# Altium schematic sheet Control.SchDoc
size A4; SheetNumber: 1; SheetTotal: 7
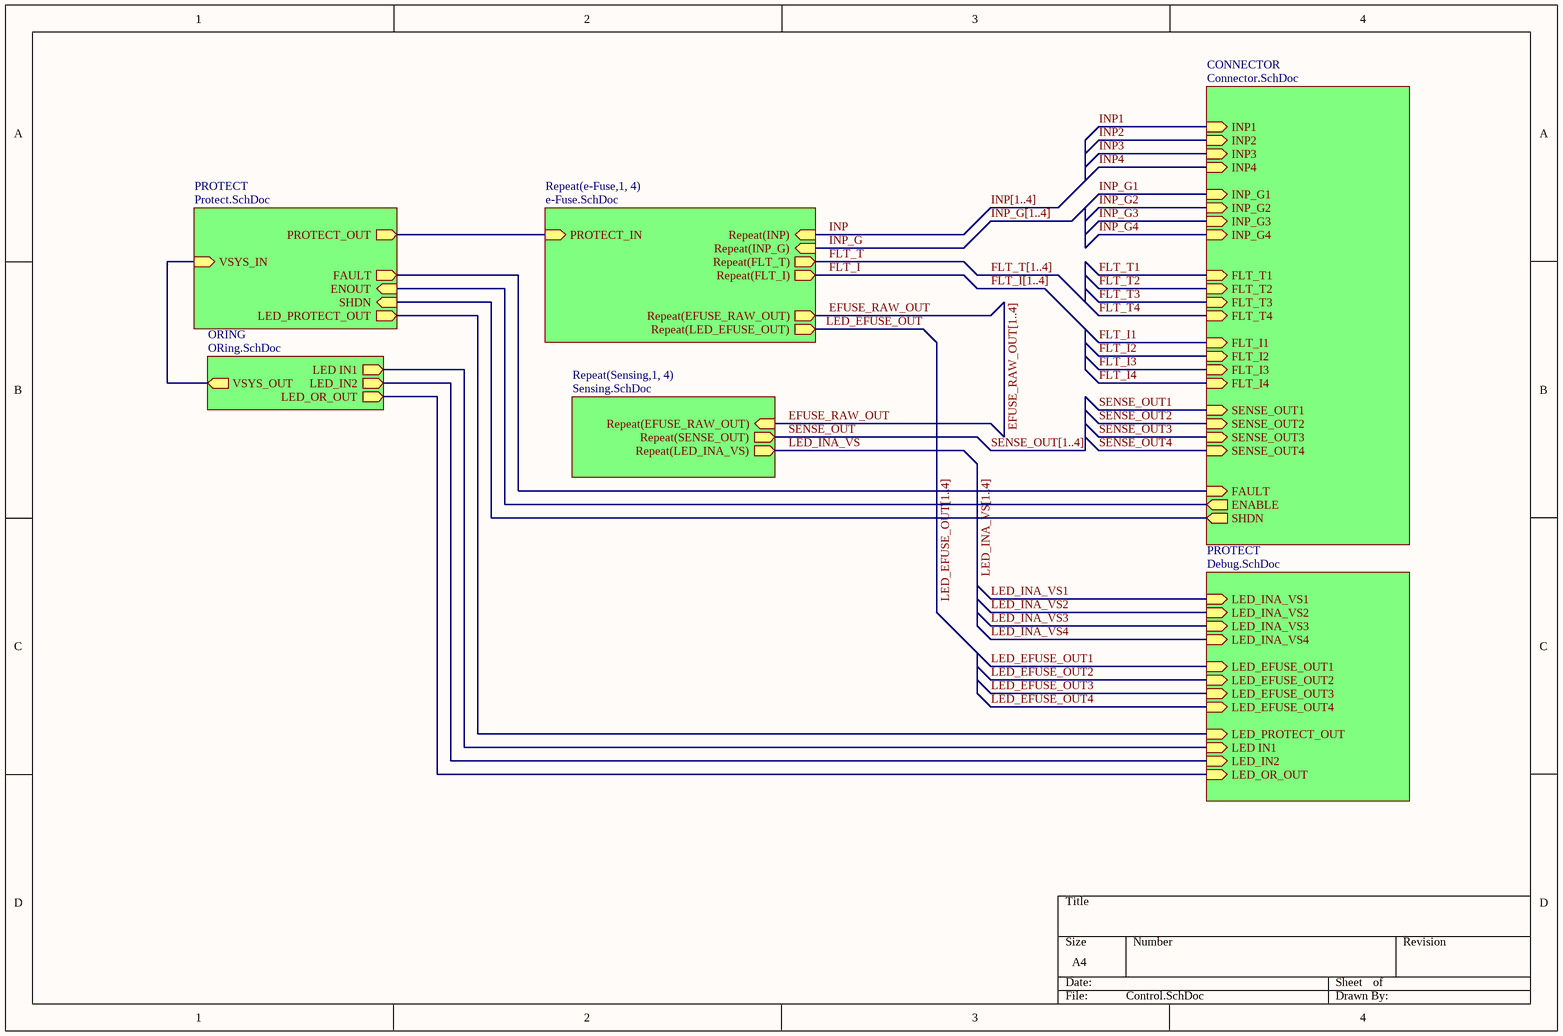
[diagram p0: Control.SchDoc]

## Sub-sheets
CONNECTOR = Connector.SchDoc: FLT_I4 (in), FLT_T4 (in), INP_G4 (in), INP4 (in), FLT_I3 (in), FLT_T3 (in), INP_G3 (in), INP3 (in), FLT_I2 (in), FLT_T2 (in), INP_G2 (in), INP2 (in), FLT_I1 (in), FLT_T1 (in), INP_G1 (in), INP1 (in), SENSE_OUT4 (in), SENSE_OUT3 (in), SENSE_OUT2 (in), SENSE_OUT1 (in), FAULT (in), ENABLE (out), SHDN (out)
ORING = ORing.SchDoc: LED IN1 (out), LED_IN2 (out), LED_OR_OUT (out), VSYS_OUT (out)
PROTECT = Protect.SchDoc: PROTECT_OUT (out), SHDN (in), FAULT (out), VSYS_IN (in), ENOUT (in), LED_PROTECT_OUT (out)
PROTECT = Debug.SchDoc: LED_INA_VS1 (in), LED_INA_VS2 (in), LED_INA_VS3 (in), LED_INA_VS4 (in), LED_OR_OUT (in), LED_IN2 (in), LED IN1 (in), LED_PROTECT_OUT (in), LED_EFUSE_OUT1 (in), LED_EFUSE_OUT2 (in), LED_EFUSE_OUT3 (in), LED_EFUSE_OUT4 (in)
Repeat(e-Fuse,1, 4) = e-Fuse.SchDoc: Repeat(EFUSE_RAW_OUT) (out), Repeat(FLT_I) (out), Repeat(FLT_T) (out), Repeat(INP_G) (in), Repeat(INP) (in), PROTECT_IN (in), Repeat(LED_EFUSE_OUT) (out)
Repeat(Sensing,1, 4) = Sensing.SchDoc: Repeat(EFUSE_RAW_OUT) (in), Repeat(SENSE_OUT) (out), Repeat(LED_INA_VS) (out)

## Nets
EFUSE_RAW_OUT: sheet Repeat(e-Fuse,1, 4)/Repeat(EFUSE_RAW_OUT), sheet Repeat(Sensing,1, 4)/Repeat(EFUSE_RAW_OUT)
FLT_I: sheet Repeat(e-Fuse,1, 4)/Repeat(FLT_I)
FLT_I1: sheet CONNECTOR/FLT_I1
FLT_I2: sheet CONNECTOR/FLT_I2
FLT_I3: sheet CONNECTOR/FLT_I3
FLT_I4: sheet CONNECTOR/FLT_I4
FLT_T: sheet Repeat(e-Fuse,1, 4)/Repeat(FLT_T)
FLT_T1: sheet CONNECTOR/FLT_T1
FLT_T2: sheet CONNECTOR/FLT_T2
FLT_T3: sheet CONNECTOR/FLT_T3
FLT_T4: sheet CONNECTOR/FLT_T4
INP: sheet Repeat(e-Fuse,1, 4)/Repeat(INP)
INP1: sheet CONNECTOR/INP1
INP2: sheet CONNECTOR/INP2
INP3: sheet CONNECTOR/INP3
INP4: sheet CONNECTOR/INP4
INP_G: sheet Repeat(e-Fuse,1, 4)/Repeat(INP_G)
INP_G1: sheet CONNECTOR/INP_G1
INP_G2: sheet CONNECTOR/INP_G2
INP_G3: sheet CONNECTOR/INP_G3
INP_G4: sheet CONNECTOR/INP_G4
LED_EFUSE_OUT: sheet Repeat(e-Fuse,1, 4)/Repeat(LED_EFUSE_OUT)
LED_EFUSE_OUT1: sheet PROTECT/LED_EFUSE_OUT1
LED_EFUSE_OUT2: sheet PROTECT/LED_EFUSE_OUT2
LED_EFUSE_OUT3: sheet PROTECT/LED_EFUSE_OUT3
LED_EFUSE_OUT4: sheet PROTECT/LED_EFUSE_OUT4
LED_INA_VS: sheet Repeat(Sensing,1, 4)/Repeat(LED_INA_VS)
LED_INA_VS1: sheet PROTECT/LED_INA_VS1
LED_INA_VS2: sheet PROTECT/LED_INA_VS2
LED_INA_VS3: sheet PROTECT/LED_INA_VS3
LED_INA_VS4: sheet PROTECT/LED_INA_VS4
SENSE_OUT: sheet Repeat(Sensing,1, 4)/Repeat(SENSE_OUT)
SENSE_OUT1: sheet CONNECTOR/SENSE_OUT1
SENSE_OUT2: sheet CONNECTOR/SENSE_OUT2
SENSE_OUT3: sheet CONNECTOR/SENSE_OUT3
SENSE_OUT4: sheet CONNECTOR/SENSE_OUT4
(unnamed): sheet PROTECT/PROTECT_OUT, sheet Repeat(e-Fuse,1, 4)/PROTECT_IN
(unnamed): sheet PROTECT/SHDN, sheet CONNECTOR/SHDN
(unnamed): sheet PROTECT/FAULT, sheet CONNECTOR/FAULT
(unnamed): sheet PROTECT/VSYS_IN, sheet ORING/VSYS_OUT
(unnamed): sheet PROTECT/ENOUT, sheet CONNECTOR/ENABLE
(unnamed): sheet PROTECT/LED_PROTECT_OUT, sheet PROTECT/LED_PROTECT_OUT
(unnamed): sheet ORING/LED IN1, sheet PROTECT/LED IN1
(unnamed): sheet ORING/LED_IN2, sheet PROTECT/LED_IN2
(unnamed): sheet ORING/LED_OR_OUT, sheet PROTECT/LED_OR_OUT

## Buses and harness runs
bus EFUSE_RAW_OUT[1..4]
bus FLT_I[1..4]
bus FLT_T[1..4]
bus INP[1..4]
bus INP_G[1..4]
bus LED_EFUSE_OUT[1..4]
bus LED_INA_VS[1..4]
bus SENSE_OUT[1..4]